# Altium project PCB_Project.PrjPcb
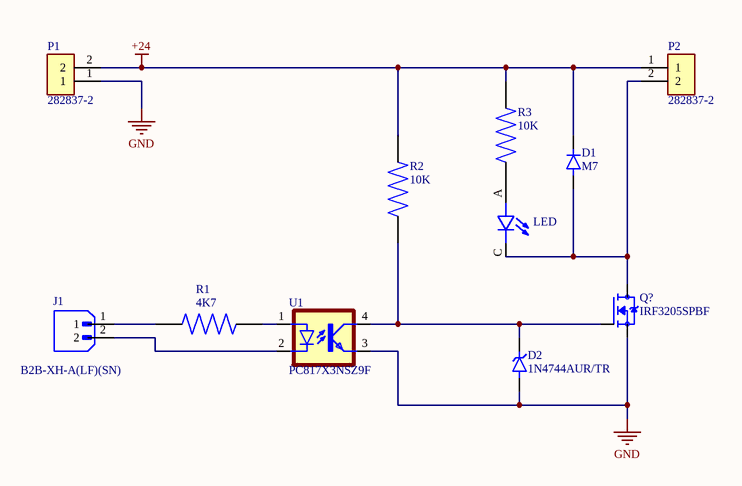
[diagram p0: Sheet1.SchDoc]
1 sheet, 11 parts. Net scope: global (net labels, ports and power ports of the same name join across sheets).
Board file: PENU_DRV_V1.0.PcbDoc

## Sheet Sheet1.SchDoc
size A4; SheetNumber: 1; SheetTotal: 1

### Parts
D1  M7  [DIO_M7]
D2  1N4744AUR/TR  [DIO_1N4744AUR/TR]
J1  B2B-XH-A(LF)(SN)  [JST_B2B-XH-A(LF)(SN)]
LED  (no value)  [LEDC2012X120N]
P1  282837-2  [TE_282837-2]
P2  282837-2  [TE_282837-2]
Q?  IRF3205SPBF  [TRANS_IRF3205SPBF]
R1  value 4K7  [RESC2012X60N]
R2  value 10K  [RESC2012X60N]
R3  value 10K  [RESC2012X60N]
U1  PC817X3NSZ9F  [DIL04]

### Nets
+24: D1.C(K) P1.2 P2.1 R2.2 R3.2
GND: D2.2(A) P1.1 Q?.3(S) U1.3(EMIT)
NetD1_A: D1.A LED.C P2.2 Q?.2(D)
NetD2_1: D2.1(K) Q?.1(G) R2.1 U1.4(COL)
NetJ1_1: J1.1 R1.1
NetJ1_2: J1.2 U1.2(C)
NetLED_A: LED.A R3.1
NetR1_2: R1.2 U1.1(A)

### Library data of the parts
D1 = M7: MF: {'manufacturer': u'Diotec Semiconductor'}; Package: None; Price: None; Value: *; MP: M7; Availability: Unavailable
D2 = 1N4744AUR/TR: MF: {'manufacturer': u'Microchip Technology'}; Package: None; Price: None; Value: *; MP: 1N4744AUR/TR; Availability: Unavailable
J1 = B2B-XH-A(LF)(SN): Connector Header Through Hole 2 position 0.098 (2.50mm); MF: JST Sales; SnapEDA_Link: https://www.snapeda.com/parts/B2B-XH-A(LF)(SN)/JST/view-part/?ref=snap; Package: None; Value: *; MP: B2B-XH-A(LF)(SN); Check_prices: https://www.snapeda.com/parts/B2B-XH-A(LF)(SN)/JST/view-part/?ref=eda
LED = SML-LXT0805IW-TR: LED;Red;11mcd;0.061In.Dia.;SMD;100mA;2V Vf;635nm;140deg;SMD;White Diffused;5V Vr | Lumex SML-LXT0805IW-TR; MF: Lumex Opto/Components; SnapEDA_Link: https://www.snapeda.com/parts/SML-LXT0805IW-TR/Lumex+Opto%252FComponents+Inc./view-part/?ref=snap; Package: 0805 Lumex; Value: LED; Check_prices: https://www.snapeda.com/parts/SML-LXT0805IW-TR/Lumex+Opto%252FComponents+Inc./view-part/?ref=eda
P1 P2 = 282837-2: Ð Ð°Ð·ÑŠÐµÐ¼Ð½Ñ‹Ðµ ÐºÐ»ÐµÐ¼Ð¼Ð½Ñ‹Ðµ ÐºÐ¾Ð»Ð¾Ð´ÐºÐ¸ Ð Ð¾Ð·ÐµÑ‚ÐºÐ° 2 Ð¿Ð¾Ð»Ð¾Ð¶ÐµÐ½Ð¸Ñ 5,08 Ð¼Ð¼ ÐŸÑ€Ð¸Ð¿Ð¾Ð¹ Ð¿Ñ€ÑÐ¼Ð¾Ð¹ Ñ‡ÐµÑ€ÐµÐ· Ð¾Ñ‚Ð²ÐµÑ€ÑÑ‚Ð¸Ðµ 13,5 Ð / ÐºÐ¾Ð½Ñ‚Ð°ÐºÑ‚; MF: TE Connectivity; SnapEDA_Link: https://www.snapeda.com/parts/282837-2/TE+Connectivity+AMP+Connectors/view-part/?ref=snap; Price: None; Check_prices: https://www.snapeda.com/parts/282837-2/TE+Connectivity+AMP+Connectors/view-part/?ref=eda; Purchase-URL: https://pricing.snapeda.com/search/part/282837-2/?ref=eda; MP: 282837-2; Value: *; Availability: In Stock; Package: None
Q? = IRF3205SPBF: RoHS Compliant | Low RDS(on) | Industry-leading quality | Dynamic dv/dt Rating | Fast Switching | Fully Avalanche Rated | 175C Operating Temperature; MF: Infineon Technologies; SnapEDA_Link: https://www.snapeda.com/parts/IRF3205SPBF/Infineon/view-part/?ref=snap; Package: D2PAK Infineon; Value: *; MP: IRF3205SPBF; Check_prices: https://www.snapeda.com/parts/IRF3205SPBF/Infineon/view-part/?ref=eda
R1-R3 = RC0805FR-07330RL: 330 Ohms Â±1% 0.125W, 1/8W Chip Resistor 0805 (2012 Metric) Moisture Resistant Thick Film; MF: Yageo; SnapEDA_Link: https://www.snapeda.com/parts/RC0805FR-07330RL/Yageo/view-part/?ref=snap; Package: 2012 Yageo; MP: RC0805FR-07330RL; Check_prices: https://www.snapeda.com/parts/RC0805FR-07330RL/Yageo/view-part/?ref=eda
U1 = PC817X3NSZ9F: Optoisolator Transistor Output 5000Vrms 1 Channel 4-DIP; MF: Sharp Microelectronics; SnapEDA_Link: https://www.snapeda.com/parts/PC817X3NSZ9F/Sharp+Microelectronics/view-part/?ref=snap; Package: DIP-4 Sharp Microelectronics; Value: *; MP: PC817X3NSZ9F; Check_prices: https://www.snapeda.com/parts/PC817X3NSZ9F/Sharp+Microelectronics/view-part/?ref=eda